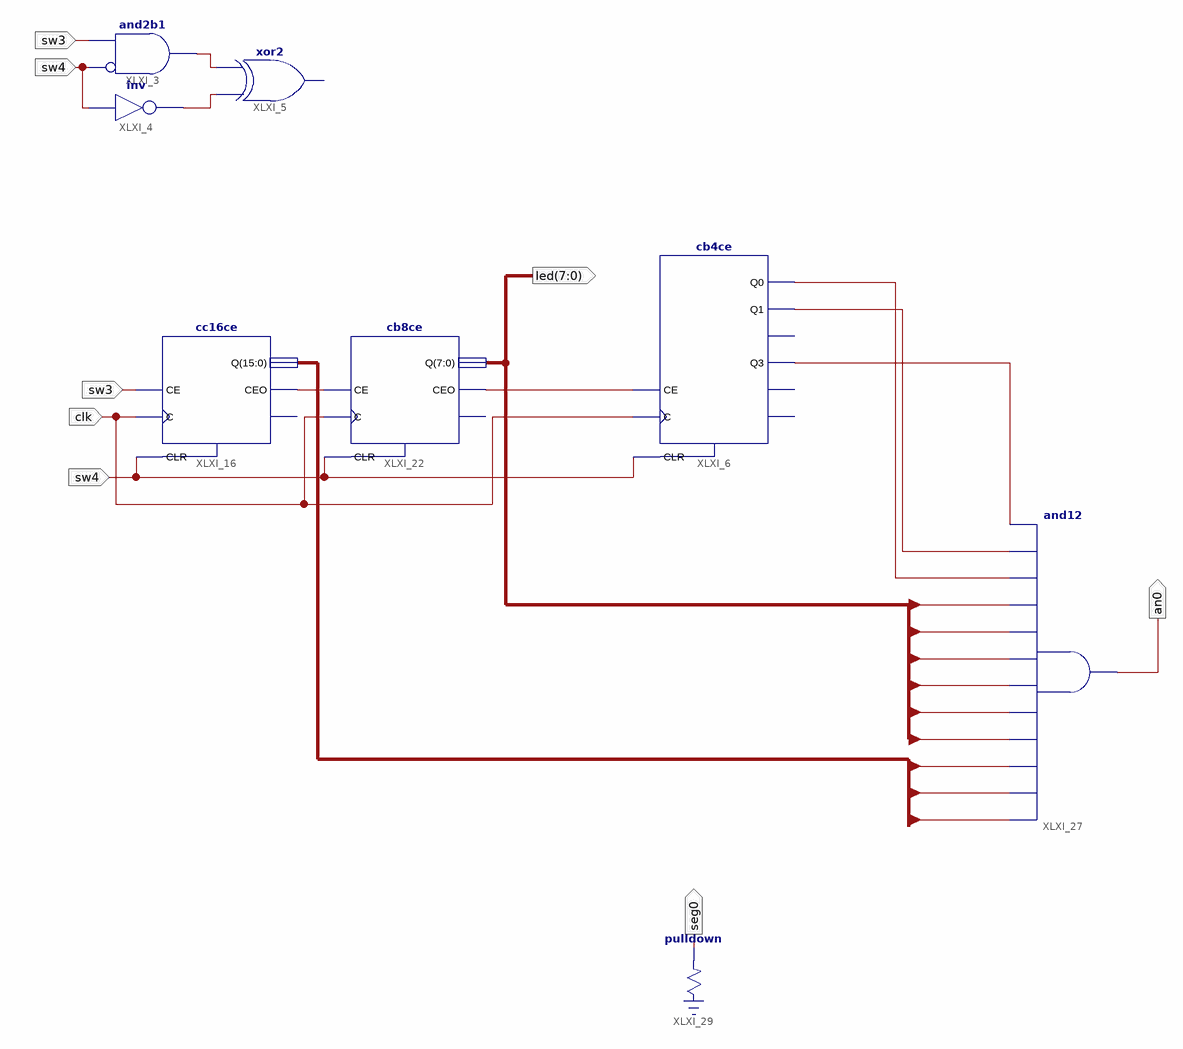
[diagram p0: schematic sheet 1]
// Xilinx ISE schematic lab1.sch (spartan6) as structural Verilog: 8 symbols, 6 ports
module lab1 (
  input  sw3,
  input  sw4,
  input  clk,
  output [7:0] led,
  output an0,
  output seg0
);

  wire XLXN_2, XLXN_3, XLXN_44, XLXN_45, XLXN_90, XLXN_91, XLXN_92;
  wire [15:0] XLXN_104;

  and XLXI_3 (XLXN_2, ~sw4, sw3);  // and2b1
  not XLXI_4 (XLXN_3, sw4);
  // xor2 XLXI_5 has open pins: I0=XLXN_3, I1=XLXN_2, O=open
  cc16ce XLXI_16 (.C(clk), .CE(sw3), .CLR(sw4), .CEO(XLXN_44), .Q(XLXN_104));  // open: TC
  cb8ce XLXI_22 (.C(clk), .CE(XLXN_44), .CLR(sw4), .CEO(XLXN_45), .Q(led));  // open: TC
  cb4ce XLXI_6 (.C(clk), .CE(XLXN_45), .CLR(sw4), .Q0(XLXN_92), .Q1(XLXN_91), .Q3(XLXN_90));  // open: CEO, Q2, TC
  and XLXI_27 (an0, XLXN_104[9], XLXN_104[14], XLXN_104[15], led[5], led[3], led[1], led[0], led[6], led[7], XLXN_92, XLXN_91, XLXN_90);
  \pulldown  XLXI_29 (.O(seg0));
endmodule
